# Altium schematic sheet double_preamp.SchDoc: 2-Channel programmable gain amplifier
size A4; DocumentNumber: ADC-SCH-07; SheetNumber: 7; SheetTotal: 20
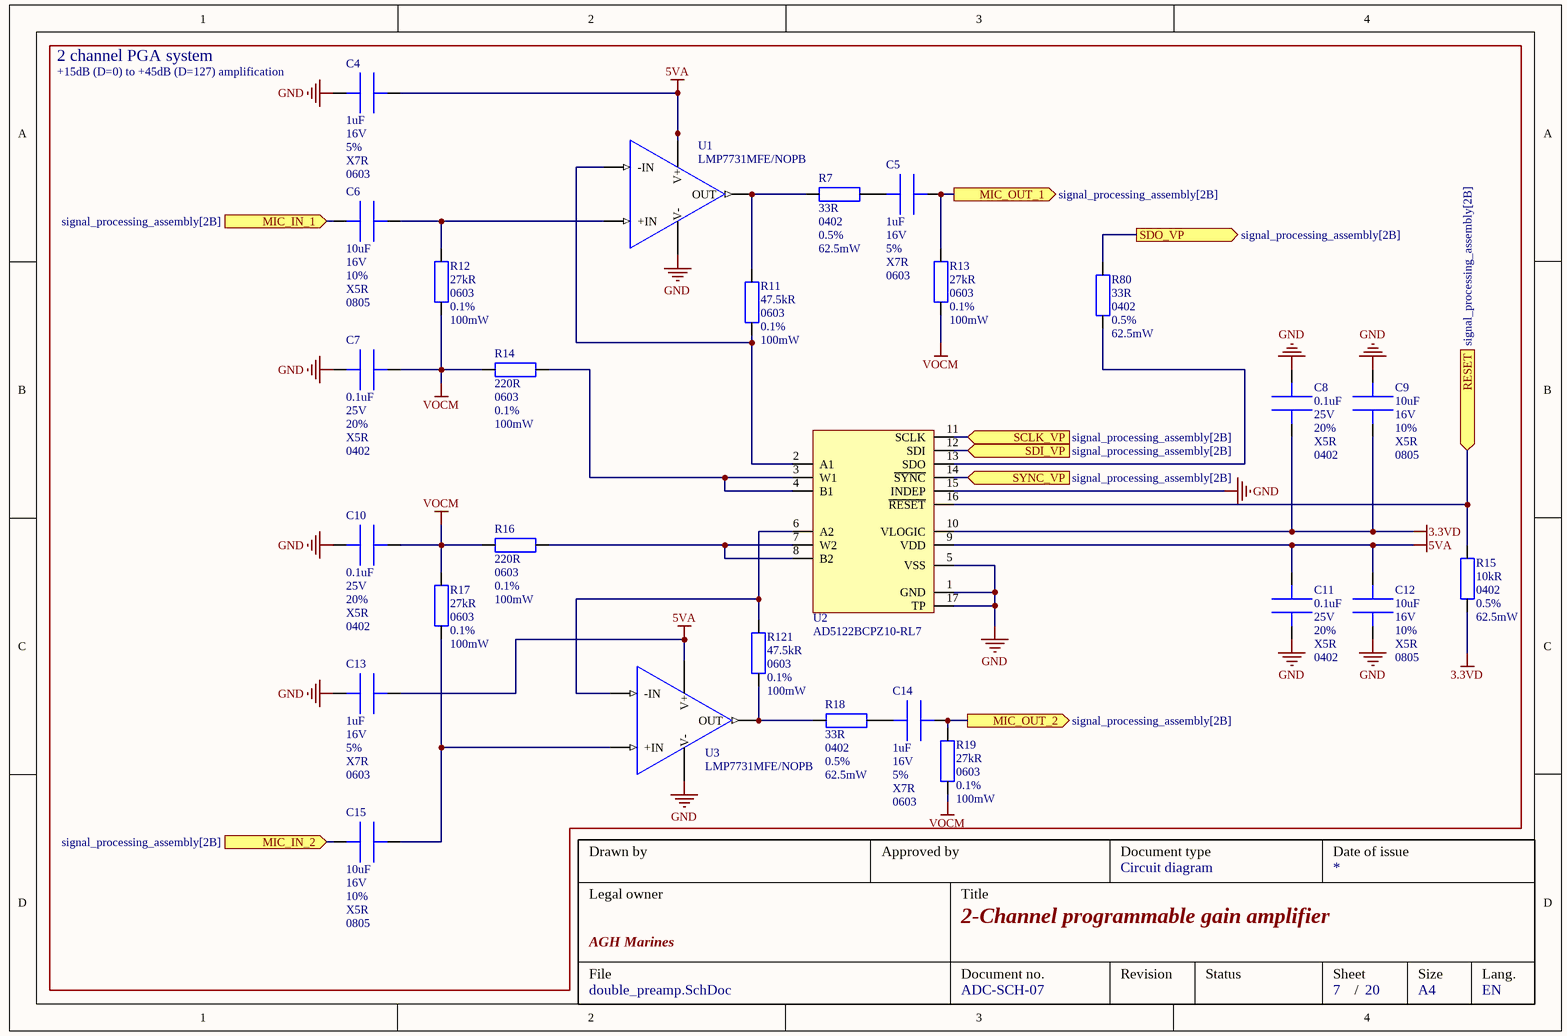
[diagram p0: double_preamp.SchDoc]

## Parts
C4  value 1uF  Voltage: 16V  Tolerance: 5%  Dielectric: X7R  Package: 0603  [CAPC_0603]  (hidden comment: CC0603JRX7R7BB105)
C5  value 1uF  Voltage: 16V  Tolerance: 5%  Dielectric: X7R  Package: 0603  [CAPC_0603]  (hidden comment: CC0603JRX7R7BB105)
C6  value 10uF  Voltage: 16V  Tolerance: 10%  Dielectric: X5R  Package: 0805  [CAPC_0805]  (hidden comment: EMK212BJ106KG-T)
C7  value 0.1uF  Voltage: 25V  Tolerance: 20%  Dielectric: X5R  Package: 0402  [CAPC_0402]  (hidden comment: MSAST105SB5104MFNA01)
C8  value 0.1uF  Voltage: 25V  Tolerance: 20%  Dielectric: X5R  Package: 0402  [CAPC_0402]  (hidden comment: MSAST105SB5104MFNA01)
C9  value 10uF  Voltage: 16V  Tolerance: 10%  Dielectric: X5R  Package: 0805  [CAPC_0805]  (hidden comment: EMK212BJ106KG-T)
C10  value 0.1uF  Voltage: 25V  Tolerance: 20%  Dielectric: X5R  Package: 0402  [CAPC_0402]  (hidden comment: MSAST105SB5104MFNA01)
C11  value 0.1uF  Voltage: 25V  Tolerance: 20%  Dielectric: X5R  Package: 0402  [CAPC_0402]  (hidden comment: MSAST105SB5104MFNA01)
C12  value 10uF  Voltage: 16V  Tolerance: 10%  Dielectric: X5R  Package: 0805  [CAPC_0805]  (hidden comment: EMK212BJ106KG-T)
C13  value 1uF  Voltage: 16V  Tolerance: 5%  Dielectric: X7R  Package: 0603  [CAPC_0603]  (hidden comment: CC0603JRX7R7BB105)
C14  value 1uF  Voltage: 16V  Tolerance: 5%  Dielectric: X7R  Package: 0603  [CAPC_0603]  (hidden comment: CC0603JRX7R7BB105)
C15  value 10uF  Voltage: 16V  Tolerance: 10%  Dielectric: X5R  Package: 0805  [CAPC_0805]  (hidden comment: EMK212BJ106KG-T)
R7  value 33R  Package: 0402  Tolerance: 0.5%  Power: 62.5mW  [RESC_0402]  (hidden comment: RG1005R-330-D-T10)
R11  value 47.5kR  Package: 0603  Tolerance: 0.1%  Power: 100mW  [RESC_0603]  (hidden comment: ERA-3AEB4752V)
R12  value 27kR  Package: 0603  Tolerance: 0.1%  Power: 100mW  [RESC_0603]  (hidden comment: ERA-3AEB273V)
R13  value 27kR  Package: 0603  Tolerance: 0.1%  Power: 100mW  [RESC_0603]  (hidden comment: ERA-3AEB273V)
R14  value 220R  Package: 0603  Tolerance: 0.1%  Power: 100mW  [RESC_0603]  (hidden comment: RT0603BRE07220RL)
R15  value 10kR  Package: 0402  Tolerance: 0.5%  Power: 62.5mW  [RESC_0402]  (hidden comment: AC0402DR-0710KL)
R16  value 220R  Package: 0603  Tolerance: 0.1%  Power: 100mW  [RESC_0603]  (hidden comment: RT0603BRE07220RL)
R17  value 27kR  Package: 0603  Tolerance: 0.1%  Power: 100mW  [RESC_0603]  (hidden comment: ERA-3AEB273V)
R18  value 33R  Package: 0402  Tolerance: 0.5%  Power: 62.5mW  [RESC_0402]  (hidden comment: RG1005R-330-D-T10)
R19  value 27kR  Package: 0603  Tolerance: 0.1%  Power: 100mW  [RESC_0603]  (hidden comment: ERA-3AEB273V)
R80  value 33R  Package: 0402  Tolerance: 0.5%  Power: 62.5mW  [RESC_0402]  (hidden comment: RG1005R-330-D-T10)
R121  value 47.5kR  Package: 0603  Tolerance: 0.1%  Power: 100mW  [RESC_0603]  (hidden comment: ERA-3AEB4752V)
U1  LMP7731MFE/NOPB  [IC_SOT-23-5]
U2  AD5122BCPZ10-RL7  [IC_LFCSP-16]
U3  LMP7731MFE/NOPB  [IC_SOT-23-5]

## Ports
MIC_IN_1 (in, see signal_processing_assembly[2B]), MIC_IN_2 (in, see signal_processing_assembly[2B]), MIC_OUT_1 (out, see signal_processing_assembly[2B]), MIC_OUT_2 (out, see signal_processing_assembly[2B]), RESET (in, see signal_processing_assembly[2B]), SCLK_VP (in, see signal_processing_assembly[2B]), SDI_VP (in, see signal_processing_assembly[2B]), SDO_VP (out, see signal_processing_assembly[2B]), SYNC_VP (in, see signal_processing_assembly[2B])

## Nets
3.3VD: C8.2 C9.2 R15.2 U2.10(VLOGIC)
5VA: C4.1 C11.1 C12.1 C13.1 U1.5(V+) U2.9(VDD) U3.5(V+)
GND: C4.2 C7.2 C8.1 C9.1 C10.2 C11.2 C12.2 C13.2 U1.2(V-) U2.1(GND) U2.5(VSS) U2.15(INDEP) U2.17(TP) U3.2(V-)
VOCM: C7.1 C10.1 R12.2 R13.2 R14.2 R16.2 R17.1 R19.2
MIC_IN_1: C6.2 ; port MIC_IN_1
MIC_IN_2: C15.2 ; port MIC_IN_2
MIC_OUT_1: C5.1 R13.1 ; port MIC_OUT_1
MIC_OUT_2: C14.1 R19.1 ; port MIC_OUT_2
RESET: R15.1 U2.16(~{RESET}) ; port RESET
SCLK_VP: U2.11(SCLK) ; port SCLK_VP
SDI_VP: U2.12(SDI) ; port SDI_VP
SDO_VP: R80.1 ; port SDO_VP
SYNC_VP: U2.14(~{SYNC}) ; port SYNC_VP
NetC5_2: C5.2 R7.1
NetC6_1: C6.1 R12.1 U1.3(+IN)
NetC14_2: C14.2 R18.1
NetC15_1: C15.1 R17.2 U3.3(+IN)
NetR7_2: R7.2 R11.1 U1.1(OUT)
NetR11_2: R11.2 U1.4(-IN) U2.2(A1)
NetR14_1: R14.1 U2.3(W1) U2.4(B1)
NetR16_1: R16.1 U2.7(W2) U2.8(B2)
NetR18_2: R18.2 R121.2 U3.1(OUT)
NetR80_2: R80.2 U2.13(SDO)
NetR121_1: R121.1 U2.6(A2) U3.4(-IN)

## Notes on the sheet
- 2 channel PGA system
- (near C4) +15dB (D=0) to +45dB (D=127) amplification
- Drawn by
- Approved by
- Document type
- Date of issue
- Legal owner
- Title
- Circuit diagram
- File
- AGH Marines
- Document no.
- Revision
- Status
- Sheet
- Size
- Lang.
- /
- A4
- EN

## Library data of the parts
C4 C5 C13 C14 = CC0603JRX7R7BB105: Multilayer Ceramic Capacitors MLCC - SMD/SMT 16V 1uF X7R 0603 5% HI CV; Manufacturer: YAGEO; Supplier 1: Mouser; Supplier Part Number 1: 603-CC0603JRX77BB105
C6 C9 C12 C15 = EMK212BJ106KG-T: Multilayer Ceramic Capacitors MLCC - SMD/SMT 16V 10uF X5R 0805 10 %; Manufacturer: TAIYO YUDEN; Supplier 1: Mouser; Supplier Part Number 1: 963-EMK212BJ106KG-T
C7 C8 C10 C11 = MSAST105SB5104MFNA01: Multilayer Ceramic Capacitors MLCC - SMD/SMT 25V 0.1uF X5R 0402 20%; Manufacturer: TAIYO YUDEN; Supplier 1: Mouser; Supplier Part Number 1: 963-MSAST105SB5104MF
R7 R18 R80 = RG1005R-330-D-T10: Thin Film Resistors - SMD 1/16W 33 Ohms 0.5% 0402 100ppm; Manufacturer: Susumu; Supplier 1: Mouser; Supplier Part Number 1: 754-RG1005R-330DT10
R11 R121 = ERA-3AEB4752V: Thin Film Resistors 0603 47.5Kohm 0.1% 25ppm; Manufacturer: Panasonic; Supplier 1: Mouser; Supplier Part Number 1: 667-ERA-3AEB4752V
R12 R13 R17 R19 = ERA-3AEB273V: Thin Film Resistors 0603 1/10W 27Kohms; Manufacturer: Panasonic; Supplier 1: Mouser; Supplier Part Number 1: 667-ERA-3AEB273V
R14 R16 = RT0603BRE07220RL: Thin Film Resistors; Manufacturer: YAGEO; Supplier 1: Mouser; Supplier Part Number 1: 603-RT0603BRE07220RL
R15 = AC0402DR-0710KL: Thick Film Resistors - SMD 10 kOhms 1/16 W 50 V 1% 0402 100 PPM / C - 55 C + 155 C AEC-Q200; Manufacturer: YAGEO; Supplier 1: Mouser; Supplier Part Number 1: 603-AC0402DR-0710KL
U1 U3 = LMP7731MFE/NOPB: Precision Amplifiers Single 2.9 nV/sqrt(H z) Low Noise Precis A 926-LMP7731MF/NOPB; Manufacturer: Texas Instruments; Package: SOT-23-5; Supplier 1: Mouser; Supplier Part Number 1: 926-LMP7731MFE/NOPB
U2 = AD5122BCPZ10-RL7: Digital Potentiometer ICs 128tap, Dual DigiPOT, NVM, SPI; Manufacturer: Analog Devices; Package: LFCSP-16; Supplier 1: Mouser; Supplier Part Number 1: 584-AD5122BCPZ10-R7